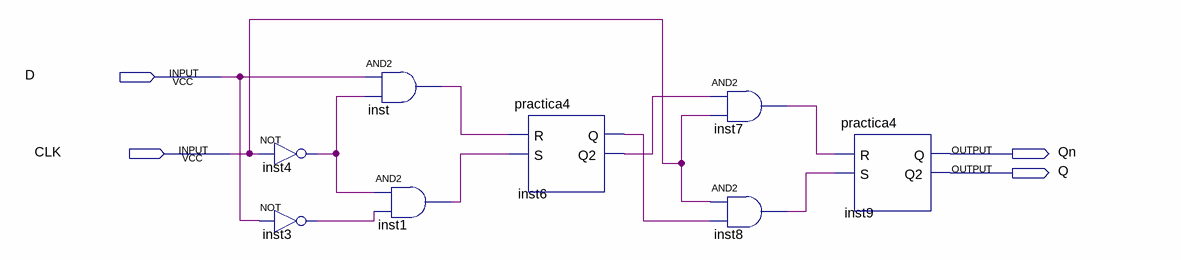
[diagram p0: schematic sheet]
// Quartus schematic Block4.bdf as structural Verilog: 8 symbols, 4 pins
module Block4 (
  input  D,
  input  CLK,
  output Qn,
  output Q
);

  wire inst1_out, inst3_out, inst4_out, inst6_q, inst6_q2, inst7_out, inst8_out, inst_out;

  not inst4 (inst4_out, CLK);
  not inst3 (inst3_out, D);
  and inst (inst_out, D, inst4_out);
  and inst1 (inst1_out, inst4_out, inst3_out);
  practica4 inst6 (.R(inst_out), .S(inst1_out), .Q(inst6_q), .Q2(inst6_q2));
  and inst7 (inst7_out, inst6_q2, CLK);
  and inst8 (inst8_out, CLK, inst6_q);
  practica4 inst9 (.R(inst7_out), .S(inst8_out), .Q(Qn), .Q2(Q));
endmodule
